# Altium schematic sheet Power-Sheet.SchDoc
size 420 x 297 mm; SheetNumber: 2; SheetTotal: 7
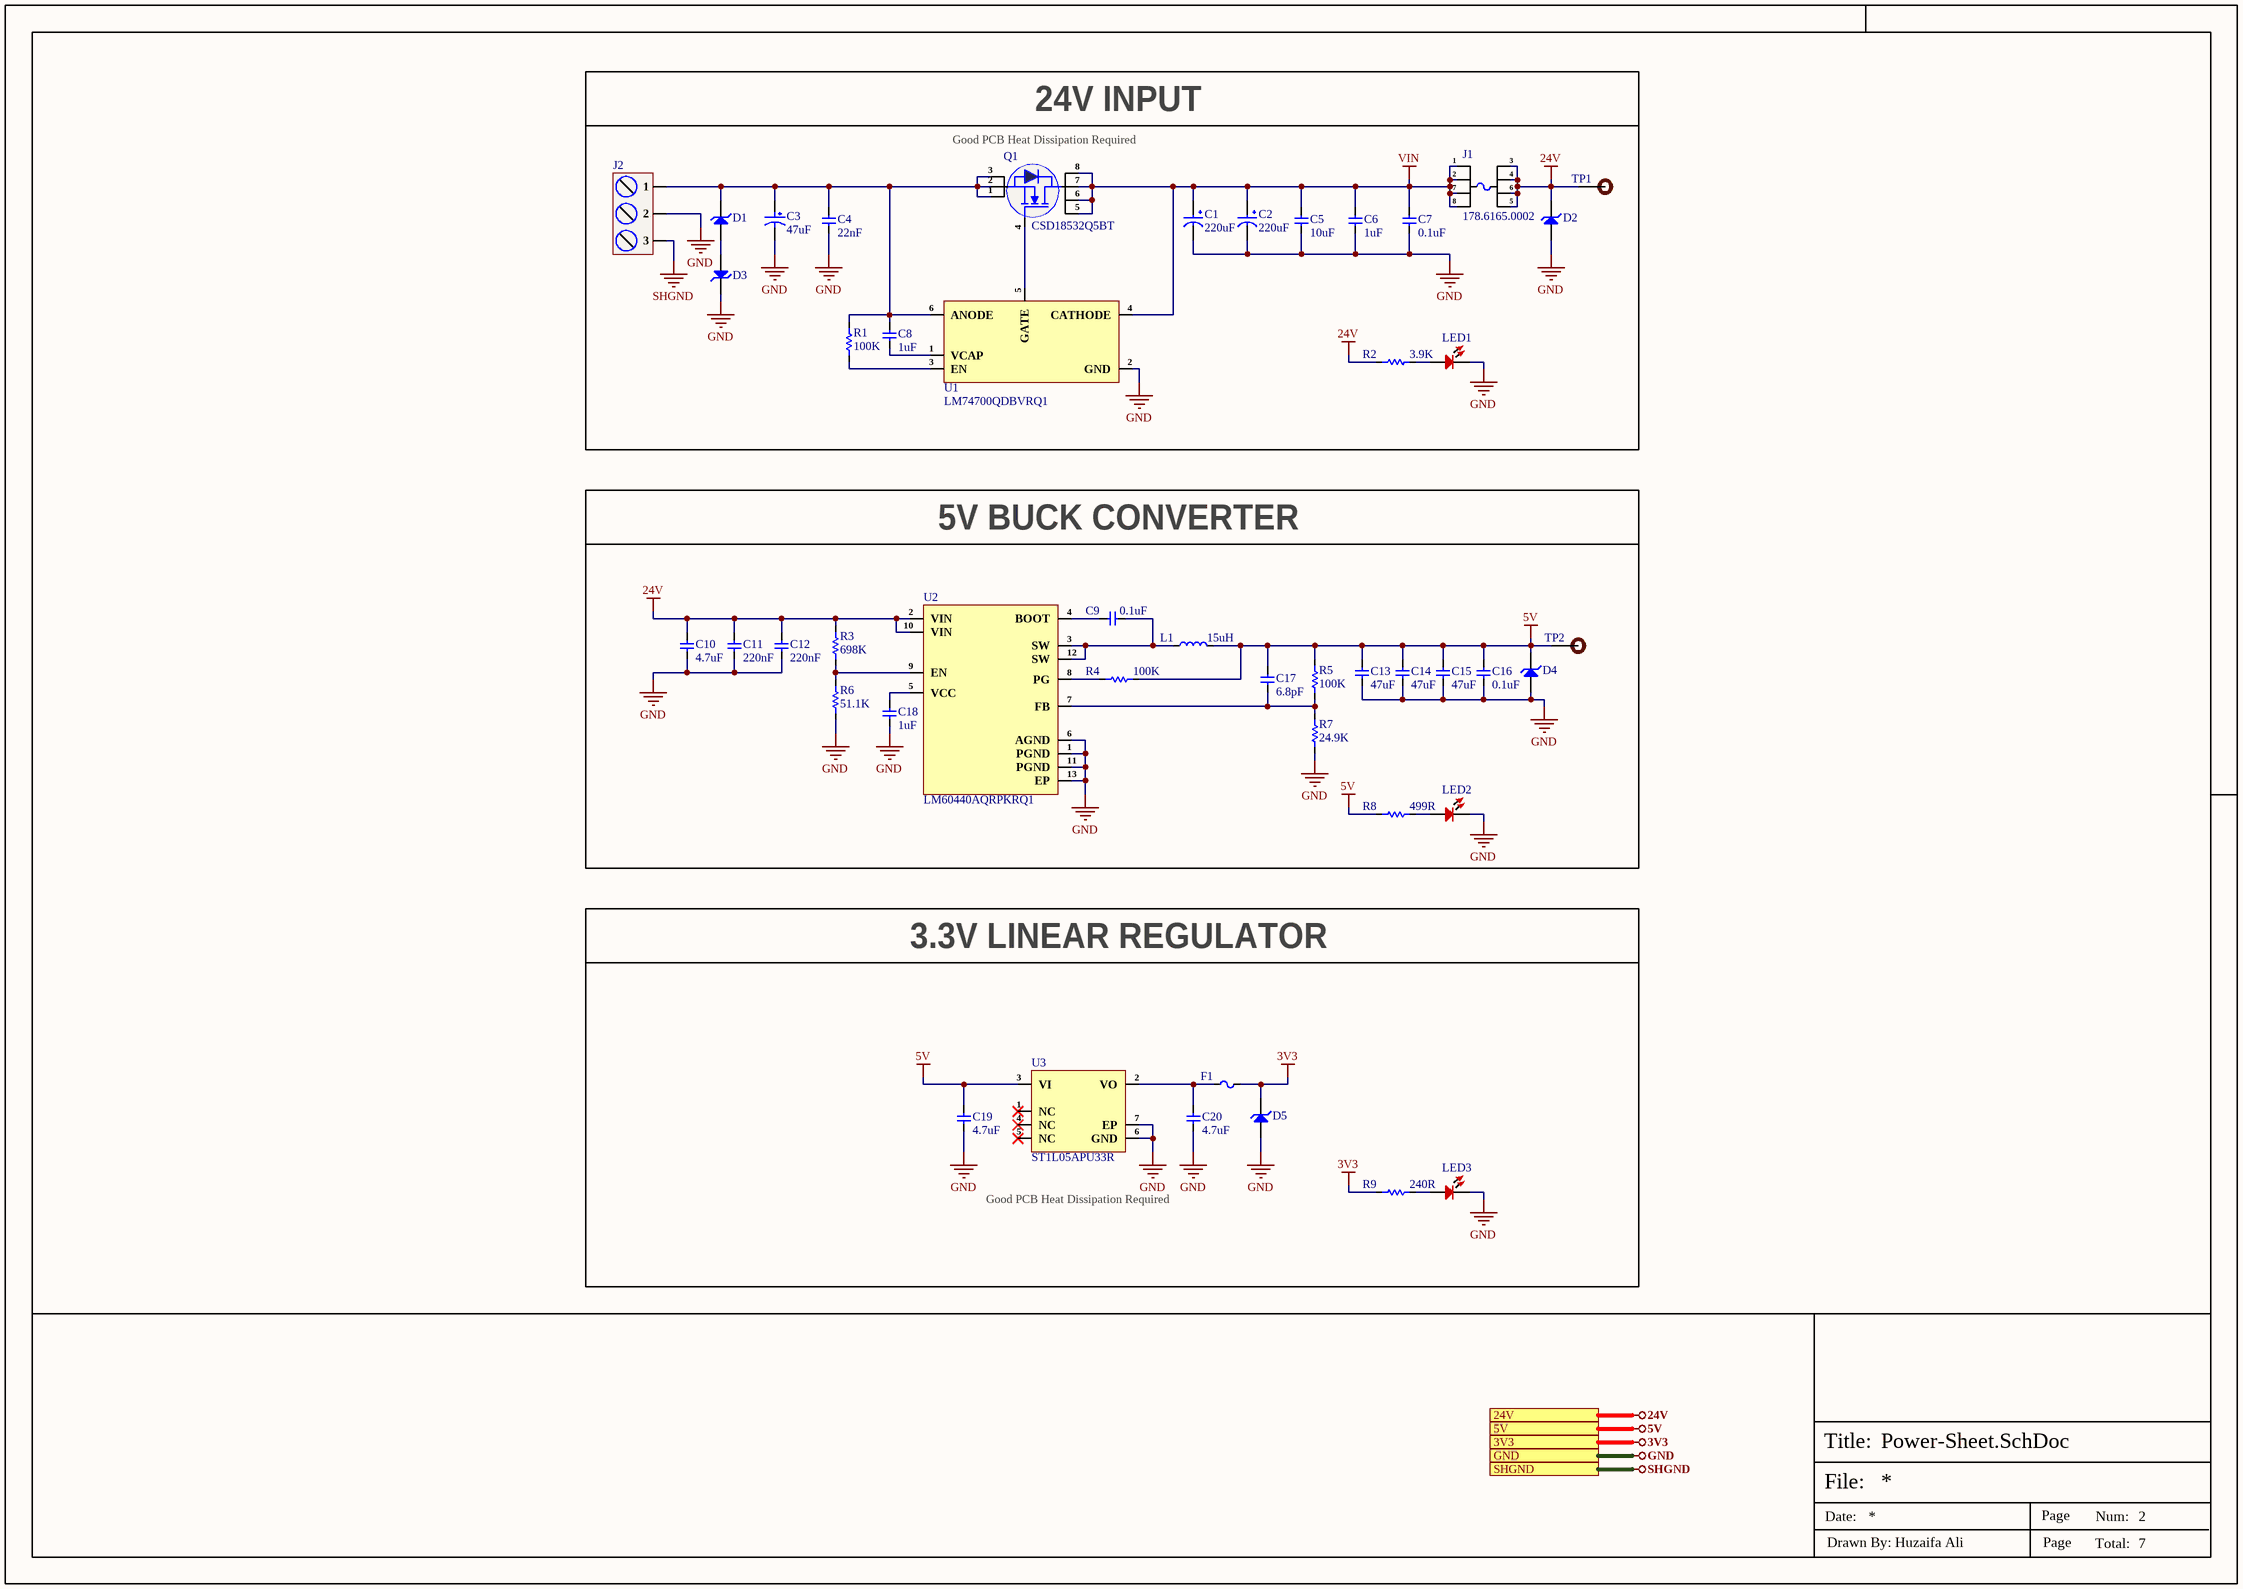
[diagram p0: Power-Sheet.SchDoc]

## Parts
C1  220uF  [UCD-220uF-10mmDia]
C2  220uF  [UCD-220uF-10mmDia]
C3  47uF  [RVT1H470M0607]
C4  22nF  [Cap-0805]
C5  10uF  [Cap-0805]
C6  1uF  [Cap-0603]
C7  0.1uF  [Cap-0603]
C8  1uF  [Cap-0603]
C9  0.1uF  [Cap-0603]
C10  4.7uF  [Cap-1206]
C11  220nF  [Cap-1206]
C12  220nF  [Cap-1206]
C13  47uF  [Cap-1206]
C14  47uF  [Cap-1206]
C15  47uF  [Cap-1206]
C16  0.1uF  [Cap-0603]
C17  6.8pF  [Cap-0402]
C18  1uF  [Cap-0603]
C19  4.7uF  [Cap-1206]
C20  4.7uF  [Cap-1206]
D1  SMBJ58A-13-F  [SMB_]  (value not drawn)
D2  AZ4024-01G  [SOD-123]  (value not drawn)
D3  SMBJ26A-13-F  [SMB_]  (value not drawn)
D4  AZ3005-01G  [SOD-123]  (value not drawn)
D5  AZ3003-01G  [SOD-123]  (value not drawn)
F1  0805L110SLYR  [Fuse-0805]  (value not drawn)
J1  178.6165.0002  [178.6165.0002]
J2  DB128L-5.08-3P-OG-S  [DB128L-5.08-3P-OG-S]  (value not drawn)
L1  15uH  [SRP1265A-150M]
LED1  RED  [LED-0603]  (value not drawn)
LED2  RED  [LED-0603]  (value not drawn)
LED3  RED  [LED-0603]  (value not drawn)
Q1  CSD18532Q5BT  [SON-8(5x6)]
R1  100K  [Res-0402]
R2  3.9K  [Res-0402]
R3  698K  [RES-0805]
R4  100K  [Res-0402]
R5  100K  [Res-0402]
R6  51.1K  [RES-0805]
R7  24.9K  [Res-0402]
R8  499R  [Res-0402]
R9  240R  [Res-0402]
TP1  TEST POINT  [Test-point]  (value not drawn)  (no BOM)
TP2  TEST POINT  [Test-point]  (value not drawn)  (no BOM)
U1  LM74700QDBVRQ1  [SOT-23-6]
U2  LM60440AQRPKRQ1  [13-WQFN-HR (3x2)]
U3  ST1L05APU33R  [DFN-6(3x3)]

## Blocks framed on the sheet
24V INPUT: C1-C8 D1-D3 J1 J2 LED1 Q1 R1 R2 TP1 U1
5V BUCK CONVERTER: C9-C18 D4 L1 LED2 R3-R8 TP2 U2
3.3V LINEAR REGULATOR: C19 C20 D5 F1 LED3 R9 U3

## Ports
3V3 (see Top-Sheet[2A], Comms-Sheet[4D], Controller-Sheet-1[4D], Controller-Sheet-2[4D], Stepper-Driver-Sheet[5D], USB-Sheet[4D]), 5V (see Top-Sheet[2A], Comms-Sheet[4D], Controller-Sheet-2[4D], USB-Sheet[4D]), 24V (see Top-Sheet[2A], Stepper-Driver-Sheet[5D]), GND (see Top-Sheet[2A], Comms-Sheet[4D], Controller-Sheet-1[4D], Controller-Sheet-2[4D], Stepper-Driver-Sheet[5D], USB-Sheet[4D]), SHGND (see Top-Sheet[2A], USB-Sheet[4D])

## Nets
3V3: D5.2(K) F1.2 R9.1 ; port 3V3
5V: C13.2 C14.2 C15.2 C16.2 C17.2 C19.2 D4.2(K) L1.2 R4.1 R5.2 R8.1 TP2.1 U3.3(VI) ; port 5V
24V: C10.2 C11.2 C12.2 D2.2(K) J1.3 J1.4 J1.5 J1.6 R2.1 R3.2 TP1.1 U2.2(VIN) U2.10(VIN) ; port 24V
GND: C1.2 C2.2 C3.2 C4.1 C5.1 C6.1 C7.1 C10.1 C11.1 C12.1 C13.1 C14.1 C15.1 C16.1 C18.1 C19.1 C20.1 D2.1(A) D3.2(K) D4.1(A) D5.1(A) J2.2 LED1.2 LED2.2 LED3.2 R6.1 R7.1 U1.2(GND) U2.1(PGND) U2.6(AGND) U2.11(PGND) U2.13(EP) U3.6(GND) U3.7(EP) ; port GND
SHGND: J2.3 ; port SHGND
VIN: C1.1 C2.1 C5.2 C6.2 C7.2 J1.1 J1.2 J1.7 J1.8 Q1.5(D) Q1.6(D) Q1.7(D) Q1.8(D) U1.4(CATHODE)
NetC3_1: C3.1 C4.2 C8.2 D1.2(K) J2.1 Q1.1(S) Q1.2(S) Q1.3(S) R1.2 U1.6(ANODE)
NetC8_1: C8.1 U1.1(VCAP)
NetC9_1: C9.1 L1.1 U2.3(SW) U2.12(SW)
NetC9_2: C9.2 U2.4(BOOT)
NetC17_1: C17.1 R5.1 R7.2 U2.7(FB)
NetC18_2: C18.2 U2.5(VCC)
NetC20_2: C20.2 F1.1 U3.2(VO)
NetD1_1: D1.1(A) D3.1(A)
NetLED1_1: LED1.1 R2.2
NetLED2_1: LED2.1 R8.2
NetLED3_1: LED3.1 R9.2
NetQ1_4: Q1.4(G) U1.5(GATE)
NetR1_1: R1.1 U1.3(EN)
NetR3_1: R3.1 R6.2 U2.9(EN)
NetR4_2: R4.2 U2.8(PG)

Not connected (* = marked no-connect by the designer): U3 1(NC)* 4(NC)* 5(NC)*

## Notes on the sheet
- (near Q1) Good PCB Heat Dissipation Required
- Good PCB Heat Dissipation Required
- File:
- Title:
- Date:
- Page
- Num:
- Total:
- Drawn By: Huzaifa Ali

## Library data of the parts
C1 C2 = UCD1H221MNL1GS: CAP ALUM 220UF 20% 50V SMD; Manufacturer: Nichicon; Ripple Current: 700mA; Impedance: 160mR; Leakage Current: 3uA; Life (Hours): 5000Hour; Dissipation Factor: 0.1%; Item Type: Capacitor; Supplier 1: Digi-Key; Manufacturer Part Number: UCD1H221MNL1GS; RoHS: Yes; Category: Aluminum Electrolytic Capacitors; Pricing 1: 1=0.85000, 10=0.60200, 50=0.45480, 100=0.39620 (USD); Mount: Surface Mount,PCB; Case/Package: Radial; Min Operating Temperature: -55°C; Max Operating Temperature: 105°C; Capacitance: 220uF; Tolerance: 20%; Voltage Rating: 50V; Packaging: Tape and Reel; Package Quantity: 1; Voltage Rating (DC): 50V; Termination: SMD/SMT; Voltage: 50V; Features: General Purpose; Series: CD; Construction: Cylindrical; Diameter: 10mm; Length: 10mm; Height: 10mm; Height - Seated (Max): 0.394inch; Radiation Hardening: No; Lead Free: Lead Free; RoHS Compliant: Yes; ComponentLink1URL: https://datasheet.ciiva.com/11776/0900766b80ebdadd-11776792.pdf?src-supplier=RSComponents; ComponentLink1Description: https://datasheet.ciiva.com/11776/0900766b80ebdadd-11776792.pdf?src-supplier=RSComponents; ComponentLink2URL: https://datasheet.ciiva.com/5362/e-cd-22158-5362489.pdf?src-supplier=Mouser; ComponentLink2Description: https://datasheet.ciiva.com/5362/e-cd-22158-5362489.pdf?src-supplier=Mouser; ComponentLink3URL: https://datasheet.ciiva.com/11684/e-cd-11684678.pdf?src-supplier=Avnet; ComponentLink3Description: https://datasheet.ciiva.com/11684/e-cd-11684678.pdf?src-supplier=Avnet; ComponentLink4URL: https://datasheet.ciiva.com/15037/e-cd-15037119.pdf?src-supplier=Digi-Key; ComponentLink4Description: https://datasheet.ciiva.com/15037/e-cd-15037119.pdf?src-supplier=Digi-Key; ComponentLink5URL: https://datasheet.ciiva.com/16393/e-cd-16393493.pdf?src-supplier=Future+Electronics; ComponentLink5Description: https://datasheet.ciiva.com/16393/e-cd-16393493.pdf?src-supplier=Future+Electronics; ComponentLink6URL: https://datasheet.ciiva.com/17354/e-cd-17354606.pdf?src-supplier=Avnet+Europe; ComponentLink6Description: https://datasheet.ciiva.com/17354/e-cd-17354606.pdf?src-supplier=Avnet+Europe; Supplier Part Number 1: 493-6390-1-ND; LCSC Part Number: C116211
C3 = RVT1H470M0607: 47uF 50V 66mA@120Hz ±20% SMD,D6.3xL7.7mm Aluminum Electrolytic Capacitors - SMD ROHS; Manufacturer: ROQANG; Manufacturer Part Number: RVT1H470M0607; Package: SMD,D6.3xL7.7mm; LCSC Part Number: C72523; Item Type: Capacitor; ComponentLink1Description: LCSC; ComponentLink1URL: https://www.lcsc.com/product-detail/Aluminum-Electrolytic-Capacitors-SMD_ROQANG-RVT1H470M0607_C72523.html
C4 = CC0805JRX7R0BB223: CAP CER 0.022UF 100V X7R 0805; Manufacturer: Yageo; Item Type: Capacitors; Tolerance: 5%; Supplier: Digikey; LCSC Part Number: C576993; Manufacturer Part Number: CC0805JRX7R0BB223; RoHS: Yes; Stock: 2257; Pricing: 1=0.13, 10=0.07, 50=0.0488, 100=0.0421, 500=0.03086, 1000=0.02736 (USD); Mounting Technology: Surface Mount; Case/Package: 0805; Min Operating Temperature: -55°C; Max Operating Temperature: 125°C; Value: 22nF; Dielectric: X7R; Construction: Flat; Length: 2mm; Height: 0.85mm; Depth: 1.25mm; RoHS Compliant: Yes; ComponentLink1URL: https://datasheet.ciiva.com/11494/upy-np0x7r-mv-100-to-630v-9-11494760.pdf?src-supplier=Avnet; ComponentLink1Description: https://datasheet.ciiva.com/11494/upy-np0x7r-mv-100-to-630v-9-11494760.pdf?src-supplier=Avnet
C5 = GRM21BR61H106ME43L: CAP CER 10UF 50V X5R 0805; Manufacturer: Murata; Supplier 1: Digi-Key; Manufacturer Part Number: GRM21BR61H106ME43L; RoHS: Yes; Category: Ceramic Capacitors; Stock 1: 26; Pricing 1: 1=0.44000, 10=0.30700, 50=0.21500, 100=0.18420, 500=0.13818, 1000=0.11668 (USD); Supplier Part Number 1: 490-18664-1-ND; LCSC Part Number: C2190942
C6 C8 C18 = CL10A105KB8NNNC: CAP CER 1UF 50V X5R 0603; Manufacturer: Samsung; Material: 4241ConductorMaterial; Tolerance: 10%; Item Type: Capacitor; Supplier: Avnet; Supplier Part Number: CL10A105KB8NNNC; Manufacturer Part Number: CL10A105KB8NNNC; RoHS: Yes; Category: Ceramic Capacitors; Stock: 780446; Pricing: 4000=0.01632, 8000=0.01595, 16000=0.01557, 24000=0.0152, 32000=0.01482 (USD); Mounting Technology: Surface Mount; Case/Package: 0603; Case Code (Metric): 1608; Case Code (Imperial): 0603; Min Operating Temperature: -55°C; Max Operating Temperature: 85°C; Packaging: Tape and Reel; Value: 1uF; Voltage Rating: 50V; Dielectric: X5R; Series: CL; Voltage Rating (DC): 50V; Length: 1.6mm; Depth: 0.8mm; Radiation Hardening: No; RoHS Compliant: Yes; ComponentLink1URL: https://datasheet.ciiva.com/26877/getdatasheetpartid-753736-26877879.pdf?src-supplier=Verical; ComponentLink1Description: https://datasheet.ciiva.com/26877/getdatasheetpartid-753736-26877879.pdf?src-supplier=Verical; LCSC Part Number: C15849
C7 C9 C16 = CL10B104KB8WPNC: CAP CER 0.1UF 50V X7R 0603; Item Type: Capacitor; Material: 4241ConductorMaterial; Value: 100nF; Tolerance: 10%; LCSC Part Number: C307348; ComponentLink1Description: LCSC; Supplier: Rs; Supplier Part Number: 2575919; RoHS: Yes; Category: Ceramic Capacitors; Stock: 400; Pricing: 100=0.021, 500=0.019, 1000=0.015, 2000=0.01 (GBP); Mounting Technology: Surface Mount; Case/Package: 0603; Case Code (Metric): 1608; Case Code (Imperial): 0603; Min Operating Temperature: -55°C; Max Operating Temperature: 125°C; Packaging: Cut Tape; Voltage Rating: 50V; Series: CL; Voltage Rating (DC): 50V; Height: 900um; Ratings: AEC-Q200; RoHS Compliant: Yes; Lead Free: 5697LeadFree; ComponentLink2URL: http://www.farnell.com/datasheets/2710560.pdf?src-supplier=Farnell; ComponentLink2Description: http://www.farnell.com/datasheets/2710560.pdf?src-supplier=Farnell; ComponentLink3URL: http://www.samsungsem.com/kr/support/product-search/mlcc/CL10B104KB8WPNC.jsp?src-supplier=Digi-Key; ComponentLink3Description: http://www.samsungsem.com/kr/support/product-search/mlcc/CL10B104KB8WPNC.jsp?src-supplier=Digi-Key; ComponentLink4URL: http://www.farnell.com/datasheets/2710560.pdf?src-supplier=Element14; ComponentLink4Description: http://www.farnell.com/datasheets/2710560.pdf?src-supplier=Element14; ComponentLink5URL: https://datasheet.octopart.com/CL10B104KB8WPNC-Samsung-Electro-Mechanics-datasheet-120093645.pdf?src-supplier=Future+Electronics; ComponentLink5Description: https://datasheet.octopart.com/CL10B104KB8WPNC-Samsung-Electro-Mechanics-datasheet-120093645.pdf?src-supplier=Future+Electronics; ComponentLink6URL: http://www.farnell.com/datasheets/2710560.pdf?src-supplier=Newark; ComponentLink6Description: http://www.farnell.com/datasheets/2710560.pdf?src-supplier=Newark; ComponentLink7URL: http://www.samsungsem.com/servlet/FileDownload?type=spec&file=CL10B104KB8WPNC.pdf&src-supplier=Avnet; ComponentLink7Description: http://www.samsungsem.com/servlet/FileDownload?type=spec&file=CL10B104KB8WPNC.pdf&src-supplier=Avnet; ComponentLink8URL: https://datasheet.octopart.com/CL10B104KB8WPNC-Samsung-datasheet-8326407.pdf?src-supplier=TME; ComponentLink8Description: https://datasheet.octopart.com/CL10B104KB8WPNC-Samsung-datasheet-8326407.pdf?src-supplier=TME
C10 C19 C20 = UMK316AB7475KL-T: CAP CER 4.7UF 50V X7R 1206; Manufacturer: Taiyo Yuden; Item Type: Capacitor; Tolerance: 10%; Supplier: Digikey; LCSC Part Number: C92853; Manufacturer Part Number: UMK316AB7475KL-T; RoHS: Yes; Stock: 392550; Pricing: 1=0.3, 10=0.198, 50=0.146, 100=0.1189, 500=0.09386, 1000=0.07925 (USD); Mounting Technology: Surface Mount; Case/Package: 1206; Pins: 2; Case Code (Metric): 3216; Case Code (Imperial): 1206; Min Operating Temperature: -55°C; Max Operating Temperature: 125°C; Value: 4.7uF; Voltage Rating: 50V; Packaging: Tape and Reel; Package Quantity: 2000; Voltage Rating (DC): 50V; Dielectric: X7R; Termination: SMD/SMT; Series: M; Construction: Flat; Length: 3.2mm; Width: 1.6mm; Height: 1.6mm; Depth: 1.6mm; Radiation Hardening: No; RoHS Compliant: Yes; Reach SVHC Compliant: Unknown; ComponentLink1URL: https://datasheet.ciiva.com/170/umk316ab7475kl-t-ss-170928.pdf?src-supplier=Digikey; ComponentLink1Description: https://datasheet.ciiva.com/170/umk316ab7475kl-t-ss-170928.pdf?src-supplier=Digikey; ComponentLink2URL: https://datasheet.ciiva.com/2990/umk316ab7475kl-t-ss-2990070.pdf?src-supplier=Avnet; ComponentLink2Description: https://datasheet.ciiva.com/2990/umk316ab7475kl-t-ss-2990070.pdf?src-supplier=Avnet; ComponentLink3URL: https://datasheet.ciiva.com/15922/1010umk316ab7475kl-t-15922628.pdf?src-supplier=Onlinecomponents.com; ComponentLink3Description: https://datasheet.ciiva.com/15922/1010umk316ab7475kl-t-15922628.pdf?src-supplier=Onlinecomponents.com; ComponentLink4URL: https://datasheet.ciiva.com/7975/1481447-7975911.pdf?src-supplier=Element14; ComponentLink4Description: https://datasheet.ciiva.com/7975/1481447-7975911.pdf?src-supplier=Element14; ComponentLink5URL: https://datasheet.ciiva.com/5413/mlcc-all-e-541559-5413006.pdf?src-supplier=Mouser; ComponentLink5Description: https://datasheet.ciiva.com/5413/mlcc-all-e-541559-5413006.pdf?src-supplier=Mouser
C11 C12 = CC1206JKX7R9BB224: CAP CER 0.22UF 50V X7R 1206; Manufacturer: Yageo; Item Type: Capacitor; Supplier: Future Electronics; Supplier Part Number: 4639209; Manufacturer Part Number: CC1206JKX7R9BB224; RoHS: Yes; Category: Ceramic Capacitors; Stock: 3000; Pricing: 3000=0.0381, 9000=0.0366, 15000=0.036, 30000=0.0351, 60000=0.0337 (USD); ComponentLink1URL: https://datasheet.ciiva.com/13210/upy-gp-np0-16v-to-50v-8-13210060.pdf?src-supplier=Mouser; ComponentLink1Description: https://datasheet.ciiva.com/13210/upy-gp-np0-16v-to-50v-8-13210060.pdf?src-supplier=Mouser; ComponentLink2URL: https://datasheet.ciiva.com/11466/upy-gphc-x7r-6-3v-to-50v-8-11466351.pdf?src-supplier=Avnet; ComponentLink2Description: https://datasheet.ciiva.com/11466/upy-gphc-x7r-6-3v-to-50v-8-11466351.pdf?src-supplier=Avnet; LCSC Part Number: C527274
C13-C15 = GRM31CR61E476ME44L: CAP CER 47UF 25V X5R 1206; Manufacturer: Murata; Tolerance: 20%; Item Type: Capacitor; Supplier 1: Digi-Key; Manufacturer Part Number: GRM31CR61E476ME44L; RoHS: Yes; Category: Ceramic Capacitors; Capacitance: 47uF; Voltage Rating (DC): 25V; Dielectric: X5R; Length: 3.2mm; Width: 1.6mm; Thickness: 1.6mm; ComponentLink1URL: https://search.murata.co.jp/Ceramy/image/img/A01X/partnumbering_e_01.pdf?src-supplier=Digi-Key; ComponentLink1Description: https://search.murata.co.jp/Ceramy/image/img/A01X/partnumbering_e_01.pdf?src-supplier=Digi-Key; Supplier Part Number 1: 490-16268-2-ND; LCSC Part Number: C403725
C17 = CC0402CRNPO9BN6R8: CAP CER 6.8PF 50V C0G/NPO 0402; Manufacturer: Yageo; Dielectric: C0G; Tolerance: 2%; Insulation Resistance: 10GR; Item Type: Capacitor; Supplier: Future Electronics; Supplier Part Number: 3247368; Manufacturer Part Number: CC0402CRNPO9BN6R8; RoHS: Yes; Category: Ceramic Capacitors; Stock: 200000; Pricing: 10000=0.0024, 40000=0.0022, 150000=0.0021, 400000=0.002, 1000000=0.0019 (USD); Mounting Technology: Surface Mount; Case/Package: 0402; Case Code (Imperial): 0402; Case Code (Metric): 1005; Weight: 2.3E-05oz; Min Operating Temperature: -55°C; Max Operating Temperature: 125°C; Value: 6.8pF; Packaging: Tape and Reel; Voltage Rating: 50V; Voltage Rating (DC): 50V; Termination: SMD/SMT; Series: CC; Construction: Flat; Length: 1mm; Width: 0.5mm; Height: 0.5mm; Depth: 0.5mm; Radiation Hardening: No; RoHS Compliant: Yes; ComponentLink1URL: https://datasheet.ciiva.com/11587/upy-gp-np0-16v-to-50v-8-11587182.pdf?src-supplier=Avnet; ComponentLink1Description: https://datasheet.ciiva.com/11587/upy-gp-np0-16v-to-50v-8-11587182.pdf?src-supplier=Avnet; LCSC Part Number: C189470
D1 = SMBJ58A-13-F: TVS DIODE 58VWM 93.6VC SMB; Manufacturer: Diodes; Supplier: Future Electronics; LCSC Part Number: C135085; Manufacturer Part Number: SMBJ58A-13-F; RoHS: Yes; Item Type: Diode; Stock: 6000; Pricing: 3000=0.0711, 9000=0.0684, 15000=0.0671, 30000=0.0655, 60000=0.063 (USD); ComponentLink1URL: https://datasheet.ciiva.com/25624/0900766b8104bed2-25624843.pdf?src-supplier=Rs; ComponentLink1Description: https://datasheet.ciiva.com/25624/0900766b8104bed2-25624843.pdf?src-supplier=Rs; ComponentLink2URL: https://datasheet.ciiva.com/15143/getdatasheetpartid-39642-15143045.pdf?src-supplier=Verical; ComponentLink2Description: https://datasheet.ciiva.com/15143/getdatasheetpartid-39642-15143045.pdf?src-supplier=Verical; ComponentLink3URL: https://datasheet.ciiva.com/4520/ds19002-4520617.pdf?src-supplier=Mouser; ComponentLink3Description: https://datasheet.ciiva.com/4520/ds19002-4520617.pdf?src-supplier=Mouser; ComponentLink4URL: https://datasheet.ciiva.com/16393/ds19002-16393005.pdf?src-supplier=Future+Electronics; ComponentLink4Description: https://datasheet.ciiva.com/16393/ds19002-16393005.pdf?src-supplier=Future+Electronics
D2 = AZ4024-01G: 26.7V 24V SOD-123 ESD and Surge Protection (TVS/ESD) ROHS; Manufacturer: AMAZING; Manufacturer Part Number: AZ4024-01G; Package: SOD-123; LCSC Part Number: C5571859; Item Type: (TVS/ESD); ComponentLink1Description: LCSC; ComponentLink1URL: https://www.lcsc.com/product-detail/ESD-and-Surge-Protection-TVS-ESD_AMAZING-AZ4024-01G_C5571859.html
D3 = SMBJ26A-13-F: TVS DIODE 26VWM 42.1VC SMB; Manufacturer: Diodes; Item Type: TVS Diodes; Supplier: Future Electronics; Supplier Part Number: 3363900; Manufacturer Part Number: SMBJ26A-13-F; RoHS: Yes; Stock: 9000; Pricing: 3000=0.0717, 9000=0.069, 15000=0.0677, 30000=0.0661, 60000=0.0635 (USD); ComponentLink1URL: https://datasheet.ciiva.com/15143/getdatasheetpartid-118169-15143570.pdf?src-supplier=Verical; ComponentLink1Description: https://datasheet.ciiva.com/15143/getdatasheetpartid-118169-15143570.pdf?src-supplier=Verical; ComponentLink2URL: https://datasheet.ciiva.com/16211/ds19002-16211003.pdf?src-supplier=Future+Electronics; ComponentLink2Description: https://datasheet.ciiva.com/16211/ds19002-16211003.pdf?src-supplier=Future+Electronics; LCSC Part Number: C135062
D4 = AZ3005-01G: 6V 5V SOD-123 ESD and Surge Protection (TVS/ESD) ROHS; Manufacturer: AMAZING; Manufacturer Part Number: AZ3005-01G; Package: SOD-123; LCSC Part Number: C7079241; Item Type: (TVS/ESD); ComponentLink1Description: LCSC; ComponentLink1URL: https://www.lcsc.com/product-detail/ESD-and-Surge-Protection-TVS-ESD_AMAZING-AZ3005-01G_C7079241.html
D5 = AZ3003-01G: TVS SURGE PROTECTOR 1-CH 3.3V; Manufacturer: Amazing; Item Type: Diode; Manufacturer Part Number: AZ3003-01G; Package: SOD-123; LCSC Part Number: -; ComponentLink1Description: Digikey; ComponentLink1URL: https://www.digikey.com/en/products/detail/amazing/AZ3003-01G/16615352?s=N4IgTCBcDaIIIC0DMAGFSC0KCMBxEAugL5A
F1 = 0805L110SLYR: PTC RESET FUSE 6V 1.1A 0805; Manufacturer: Littelfuse; Item Type: Fuses; Supplier: Digikey; LCSC Part Number: C207024; Manufacturer Part Number: 0805L110SLYR; RoHS: Yes; Stock: 3032; Pricing: 1=1.74, 5=1.448, 10=1.339, 50=1.1156, 100=1.0309, 250=0.92832, 500=0.85714, 1000=0.79108 (USD); ComponentLink1URL: https://datasheet.ciiva.com/326/littelfuse-resettable-ptcs-lorho-datasheet-326160.pdf?src-supplier=Digikey; ComponentLink1Description: https://datasheet.ciiva.com/326/littelfuse-resettable-ptcs-lorho-datasheet-326160.pdf?src-supplier=Digikey; ComponentLink2URL: https://datasheet.ciiva.com/28410/949281-28410775.pdf?src-supplier=Element14; ComponentLink2Description: https://datasheet.ciiva.com/28410/949281-28410775.pdf?src-supplier=Element14
J1 = 178.6165.0002: FUSE HOLDER BLADE 80V PCB; Manufacturer: Littelfuse Wickmann; Body Material: 4896ConductorMaterial; Current Rating: 30A; Supplier: Future Electronics; Supplier Part Number: 9883406; Manufacturer Part Number: 178.6165.0002; RoHS: Yes; Category: Fuse Holders; Stock: 3811; Pricing: 1=2.02, 40=1.96, 125=1.91, 400=1.86, 1250=1.77 (USD); Material: 4896ConductorMaterial; Width: 17.5mm; Thickness: 6mm; Lead Free: 5697LeadFree; ComponentLink1URL: https://datasheet.ciiva.com/295/littelfuse-ato-pcb-fuse-holders-178-6765-295568.pdf?src-supplier=Digikey; ComponentLink1Description: https://datasheet.ciiva.com/295/littelfuse-ato-pcb-fuse-holders-178-6765-295568.pdf?src-supplier=Digikey; ComponentLink2URL: https://datasheet.ciiva.com/4480/flrholder-58019-4480354.pdf?src-supplier=Mouser; ComponentLink2Description: https://datasheet.ciiva.com/4480/flrholder-58019-4480354.pdf?src-supplier=Mouser; ComponentLink3URL: https://datasheet.ciiva.com/16372/flrholder-16372408.pdf?src-supplier=Future+Electronics; ComponentLink3Description: https://datasheet.ciiva.com/16372/flrholder-16372408.pdf?src-supplier=Future+Electronics; ComponentLink4URL: https://datasheet.ciiva.com/15187/getdatasheetpartid-31610-15187861.pdf?src-supplier=Verical; ComponentLink4Description: https://datasheet.ciiva.com/15187/getdatasheetpartid-31610-15187861.pdf?src-supplier=Verical; LCSC Part Number: C207061; Item Type: Fuse Holder
J2 = DB128L-5.08-3P-OG-S: 1x3P 18A -40℃~+105℃ 250V Orange 12~30 Direct Insert 5.08mm 2.5 1 3 Plugin,P=5.08mm Screw Terminal Blocks ROHS; Manufacturer: DORABO; Manufacturer Part Number: DB128L-5.08-3P-OG-S; Package: Plugin,P=5.08mm; LCSC Part Number: C430604; Item Type: Terminal Block; ComponentLink1Description: LCSC; ComponentLink1URL: https://www.lcsc.com/product-detail/Screw-Terminal-Blocks_DORABO-DB128L-5-08-3P-OG-S_C430604.html
L1 = SRP1265A-150M: FIXED IND 15UH 9A 28 MOHM SMD; Manufacturer: Bourns; Item Type: Inductors; Supplier: Digikey; LCSC Part Number: C189912; Manufacturer Part Number: SRP1265A-150M; RoHS: Yes; Stock: 3333; Pricing: 1=1.86, 10=1.446, 25=1.3076, 50=1.2114, 100=1.1221, 250=1.0136 (USD); ComponentLink1URL: http://www.mouser.com/ds/2/54/SRP1265A-558458.pdf?src-supplier=Mouser; ComponentLink1Description: http://www.mouser.com/ds/2/54/SRP1265A-558458.pdf?src-supplier=Mouser; ComponentLink2URL: https://media.digikey.com/pdf/Data%20Sheets/Bourns%20PDFs/SRP_Series_Bltn.pdf?src-supplier=Digikey; ComponentLink2Description: https://media.digikey.com/pdf/Data%20Sheets/Bourns%20PDFs/SRP_Series_Bltn.pdf?src-supplier=Digikey; ComponentLink3URL: http://components.arrow.com/part/dataview/66888460S852199N9116?src-supplier=Arrow+Electronics; ComponentLink3Description: http://components.arrow.com/part/dataview/66888460S852199N9116?src-supplier=Arrow+Electronics; ComponentLink4URL: http://www.farnell.com/datasheets/2059704.pdf?src-supplier=Farnell; ComponentLink4Description: http://www.farnell.com/datasheets/2059704.pdf?src-supplier=Farnell; ComponentLink5URL: http://uk.rs-online.com/webdocs/133a/0900766b8133ab5d.pdf?src-supplier=Rs; ComponentLink5Description: http://uk.rs-online.com/webdocs/133a/0900766b8133ab5d.pdf?src-supplier=Rs; ComponentLink6URL: http://www.alliedelec.com/images/products/datasheets/bm/BOURNS/70377570.pdf?src-supplier=Allied+Electronics; ComponentLink6Description: http://www.alliedelec.com/images/products/datasheets/bm/BOURNS/70377570.pdf?src-supplier=Allied+Electronics; ComponentLink7URL: https://datasheet.octopart.com/SRP1265A-150M-Bourns-datasheet-57227458.pdf?src-supplier=Newark; ComponentLink7Description: https://datasheet.octopart.com/SRP1265A-150M-Bourns-datasheet-57227458.pdf?src-supplier=Newark; ComponentLink8URL: http://www.bourns.com/data/global/pdfs/SRP1265A.pdf?src-supplier=Avnet; ComponentLink8Description: http://www.bourns.com/data/global/pdfs/SRP1265A.pdf?src-supplier=Avnet; ComponentLink9URL: http://www.farnell.com/datasheets/2059704.pdf?src-supplier=Newark; ComponentLink9Description: http://www.farnell.com/datasheets/2059704.pdf?src-supplier=Newark; ComponentLink10URL: http://www.farnell.com/datasheets/2059704.pdf?src-supplier=Element14; ComponentLink10Description: http://www.farnell.com/datasheets/2059704.pdf?src-supplier=Element14
LED1-LED3 = NCD0603R3: RED LED 0603 Light Emitting Diodes; Manufacturer: Foshan NationStar Optoelectronics; Manufacturer Part Number: NCD0603R3; Package: 0603; Item Type: LED; LCSC Part Number: C3151730; ComponentLink1Description: LCSC; ComponentLink1URL: https://www.lcsc.com/product-detail/Light-Emitting-Diodes-LED_Foshan-NationStar-Optoelectronics-NCD0603R3_C3151730.html
Q1 = CSD18532Q5BT: MOSFET N-CH 60V 100A 8VSON; Manufacturer: Texas Instruments; Item Type: MOSFETs; Supplier: Mouser; LCSC Part Number: C2876541; Manufacturer Part Number: CSD18532Q5BT; RoHS: Yes; Stock: 1375; Pricing: 1=2.24, 10=2.01, 50=2.01, 100=1.79, 1000=1.34, 10000=1.23 (USD); ComponentLink1URL: http://www.ti.com/general/docs/lit/getliterature.tsp?genericPartNumber=CSD18532Q5B&&fileType=pdf&src-supplier=Avnet; ComponentLink1Description: http://www.ti.com/general/docs/lit/getliterature.tsp?genericPartNumber=CSD18532Q5B&&fileType=pdf&src-supplier=Avnet; ComponentLink2URL: http://www.ti.com/general/docs/suppproductinfo.tsp?distId=10&amp;gotoUrl=http%3A%2F%2Fwww.ti.com%2Flit%2Fgpn%2Fcsd18532q5b&src-supplier=Digikey; ComponentLink2Description: http://www.ti.com/general/docs/suppproductinfo.tsp?distId=10&amp;gotoUrl=http%3A%2F%2Fwww.ti.com%2Flit%2Fgpn%2Fcsd18532q5b&src-supplier=Digikey; ComponentLink3URL: http://www.ti.com/lit/ds/symlink/csd18532q5b.pdf?src-supplier=Digikey; ComponentLink3Description: http://www.ti.com/lit/ds/symlink/csd18532q5b.pdf?src-supplier=Digikey; ComponentLink4URL: http://www.ti.com/lit/gpn/csd18532q5b?src-supplier=Mouser; ComponentLink4Description: http://www.ti.com/lit/gpn/csd18532q5b?src-supplier=Mouser
R1 R4 R5 = RT0402BRD07100KL: RES SMD 100K OHM 0.1% 1/16W 0402; Manufacturer: Yageo; Voltage Rating (DC): 50V; Item Type: Resistor; Manufacturer Part Number: RT0402BRD07100KL; RoHS: Yes; Category: Chip SMD Resistors; ComponentLink1URL: https://datasheet.ciiva.com/12724/pyu-rt-1-to-0-05-rohs-l-4-12724954.pdf?src-supplier=Mouser; ComponentLink1Description: https://datasheet.ciiva.com/12724/pyu-rt-1-to-0-05-rohs-l-4-12724954.pdf?src-supplier=Mouser; LCSC Part Number: C852472; Supplier: Digikey; Supplier Part Number: YAG1343CT-ND; Stock: 62932; Pricing: 1=0.16, 10=0.121, 50=0.0958, 100=0.0859, 500=0.0654, 1000=0.0578, 5000=0.04283 (USD)
R2 = RC0402FR-073K9L: RES 3.9K OHM 1% 1/16W 0402; Manufacturer: Yageo; Temperature Coefficient: 100ppm/°C; Power Rating: 62.5mW; Value: 3.9kR; Voltage Rating: 50V; Max Power Dissipation: 63mW; Item Type: Resistor; Supplier: Future Electronics; Supplier Part Number: 9808155; Manufacturer Part Number: RC0402FR-073K9L; RoHS: Yes; Category: Chip SMD Resistors; Stock: 6910000; Pricing: 10000=0.0011, 100000=0.0011, 300000=0.001, 750000=0.001, 2000000=0.0009 (USD); Case/Package: 0402; Case Code (Imperial): 0402; Case Code (Metric): 1005; Min Operating Temperature: -55°C; Max Operating Temperature: 155°C; Tolerance: 1%; Packaging: Tape and Reel; Resistor Type: Thick Film; Series: RC; Termination: SMD/SMT; Number of Terminations: 2; Features: Moisture Resistant; Resistance Tolerance: 1%; Construction: Rectangular; Voltage Rating (AC): 50V; Length: 1mm; Depth: 0.5mm; Lead Free: Lead Free; RoHS Compliant: Yes; Reach SVHC Compliant: Unknown; Military Standard: Not; ComponentLink1URL: https://datasheet.ciiva.com/12666/pyu-rc0402-51-rohs-l-6-r-12666997.pdf?src-supplier=Mouser; ComponentLink1Description: https://datasheet.ciiva.com/12666/pyu-rc0402-51-rohs-l-6-r-12666997.pdf?src-supplier=Mouser; ComponentLink2URL: https://datasheet.ciiva.com/7849/1018594-7849989.pdf?src-supplier=Element14; ComponentLink2Description: https://datasheet.ciiva.com/7849/1018594-7849989.pdf?src-supplier=Element14; ComponentLink3URL: https://datasheet.ciiva.com/7849/1018594-7849990.pdf?src-supplier=Element14; ComponentLink3Description: https://datasheet.ciiva.com/7849/1018594-7849990.pdf?src-supplier=Element14; ComponentLink4URL: https://datasheet.ciiva.com/15189/getdatasheetpartid-469246-15189453.pdf?src-supplier=Verical; ComponentLink4Description: https://datasheet.ciiva.com/15189/getdatasheetpartid-469246-15189453.pdf?src-supplier=Verical; LCSC Part Number: C131467
R3 = RT0805BRD07698KL: RES SMD 698K OHM 0.1% 1/8W 0805; Manufacturer: Yageo; Item Type: Resistor; Value: 698kR; Power Rating: 125mW; Voltage Rating: 150V; Temperature Coefficient: 25ppm/°C; Supplier: Digikey; LCSC Part Number: C865618; Manufacturer Part Number: RT0805BRD07698KL; RoHS: Yes; Stock: 881; Pricing: 1=0.16, 10=0.122, 50=0.0968, 100=0.0867, 500=0.0663, 1000=0.05814 (USD); Case/Package: 0805; Case Code (Metric): 2012; Case Code (Imperial): 0805; Min Operating Temperature: -55°C; Max Operating Temperature: 155°C; Package Quantity: 5000; Packaging: Tape and Reel; Tolerance: 0.1%; Number of Terminations: 2; Termination: SMD/SMT; Max Power Dissipation: 125mW; Voltage Rating (DC): 150V; Features: Moisture Resistant; Series: RT; Length: 0.079inch; Width: 0.049inch; Height: 0.024inch; Lead Free: Lead Free; RoHS Compliant: Yes; ComponentLink1URL: https://datasheet.ciiva.com/2585/pyu-rt-1-to-0-05-rohs-l-4-2585147.pdf?src-supplier=Digikey; ComponentLink1Description: https://datasheet.ciiva.com/2585/pyu-rt-1-to-0-05-rohs-l-4-2585147.pdf?src-supplier=Digikey; ComponentLink2URL: https://datasheet.ciiva.com/46635/pyu-rt-1-to-0-05-rohs-l-5-46635259.pdf?src-supplier=Digikey; ComponentLink2Description: https://datasheet.ciiva.com/46635/pyu-rt-1-to-0-05-rohs-l-5-46635259.pdf?src-supplier=Digikey; ComponentLink3URL: https://datasheet.ciiva.com/12705/pyu-rt-1-to-0-05-rohs-l-4-12705823.pdf?src-supplier=Mouser; ComponentLink3Description: https://datasheet.ciiva.com/12705/pyu-rt-1-to-0-05-rohs-l-4-12705823.pdf?src-supplier=Mouser
R6 = RT0805BRD0751K1L: RES SMD 51.1K OHM 0.1% 1/8W 0805; Manufacturer: Yageo; Item Type: Resistors; Value: 51.1kR; Power Rating: 125mW; Voltage Rating: 150V; Temperature Coefficient: 25ppm/°C; Supplier: Digikey; LCSC Part Number: C865541; Manufacturer Part Number: RT0805BRD0751K1L; RoHS: Yes; Stock: 5132; Pricing: 1=0.16, 10=0.122, 50=0.0968, 100=0.0867, 500=0.0663, 1000=0.05814 (USD); Case/Package: 0805; Case Code (Metric): 2012; Case Code (Imperial): 0805; Weight: 0.000194oz; Min Operating Temperature: -55°C; Max Operating Temperature: 155°C; Package Quantity: 5000; Packaging: Tape and Reel; Tolerance: 0.1%; Number of Terminations: 2; Termination: SMD/SMT; Max Power Dissipation: 125mW; Voltage Rating (DC): 150V; Series: RT; Length: 0.079inch; Width: 1.2mm; Height: 0.024inch; Lead Free: Lead Free; RoHS Compliant: Yes; ComponentLink1URL: https://datasheet.ciiva.com/12811/pyu-rt-1-to-0-05-rohs-l-4-12811148.pdf?src-supplier=Mouser; ComponentLink1Description: https://datasheet.ciiva.com/12811/pyu-rt-1-to-0-05-rohs-l-4-12811148.pdf?src-supplier=Mouser; ComponentLink2URL: https://datasheet.ciiva.com/2585/pyu-rt-1-to-0-05-rohs-l-5-2585074.pdf?src-supplier=Digikey; ComponentLink2Description: https://datasheet.ciiva.com/2585/pyu-rt-1-to-0-05-rohs-l-5-2585074.pdf?src-supplier=Digikey
R7 = RT0402BRD0724K9L: RES SMD 24.9KOHM 0.1% 1/16W 0402; Manufacturer: Yageo; Item Type: Resistors; Supplier: Future Electronics; LCSC Part Number: C852664; Manufacturer Part Number: RT0402BRD0724K9L; RoHS: Yes; Stock: 40000; Pricing: 10000=0.0362, 20000=0.0356, 30000=0.0353, 50000=0.0349, 100000=0.0341 (USD); ComponentLink1URL: https://datasheet.ciiva.com/2582/pyu-rt-1-to-0-05-rohs-l-4-2582251.pdf?src-supplier=Digikey; ComponentLink1Description: https://datasheet.ciiva.com/2582/pyu-rt-1-to-0-05-rohs-l-4-2582251.pdf?src-supplier=Digikey; ComponentLink2URL: https://datasheet.ciiva.com/12721/pyu-rt-1-to-0-05-rohs-l-4-12721846.pdf?src-supplier=Mouser; ComponentLink2Description: https://datasheet.ciiva.com/12721/pyu-rt-1-to-0-05-rohs-l-4-12721846.pdf?src-supplier=Mouser; ComponentLink3URL: https://datasheet.ciiva.com/46635/pyu-rt-1-to-0-05-rohs-l-5-46635119.pdf?src-supplier=Digikey; ComponentLink3Description: https://datasheet.ciiva.com/46635/pyu-rt-1-to-0-05-rohs-l-5-46635119.pdf?src-supplier=Digikey
R8 = RC0402FR-07499RL: RES 499 OHM 1% 1/16W 0402; Manufacturer: Yageo; Power Rating: 62.5mW; Voltage Rating: 50V; Max Power Dissipation: 63mW; Temperature Coefficient: 100ppm/°C; Supplier 1: Mouser; Manufacturer Part Number: RC0402FR-07499RL; RoHS: Yes; Category: Chip SMD Resistors; Stock 1: 936879; Pricing 1: 1=0.10000, 10=0.01200, 50=0.01200, 100=0.00500, 1000=0.00300, 10000=0.00100 (USD); Case/Package: 0402; Case Code (Metric): 1005; Case Code (Imperial): 0402; Size Code: 0402; Min Operating Temperature: -55°C; Max Operating Temperature: 155°C; Resistance: 499R; Tolerance: 1%; Package Quantity: 1; Packaging: Tape and Reel; Resistor Type: Thick Film; Number of Terminations: 2; Termination: SMD/SMT; Voltage Rating (DC): 50V; Features: Moisture Resistant; Series: RC; Resistance Tolerance: 1%; Construction: Rectangular; Length: 1mm; Width: 0.02inch; Height: 0.016inch; Depth: 0.5mm; RoHS Compliant: Yes; REACH SVHC: No SVHC; Military Standard: Not; Lead Free: Lead Free; ComponentLink1URL: https://datasheet.ciiva.com/2453/pyu-r-int-thick-7-2453539.pdf?src-supplier=Digi-Key; ComponentLink1Description: https://datasheet.ciiva.com/2453/pyu-r-int-thick-7-2453539.pdf?src-supplier=Digi-Key; ComponentLink2URL: https://datasheet.ciiva.com/2453/pyu-r-int-thick-7-2453540.pdf?src-supplier=Digi-Key; ComponentLink2Description: https://datasheet.ciiva.com/2453/pyu-r-int-thick-7-2453540.pdf?src-supplier=Digi-Key; ComponentLink3URL: https://datasheet.ciiva.com/2453/pyu-r-int-thick-7-2453538.pdf?src-supplier=Digi-Key; ComponentLink3Description: https://datasheet.ciiva.com/2453/pyu-r-int-thick-7-2453538.pdf?src-supplier=Digi-Key; Supplier Part Number 1: 603-RC0402FR-07499RL; LCSC Part Number: C137970
R9 = RC0402FR-07240RL: RES 240 OHM 1% 1/16W 0402; Manufacturer: Yageo; Item Type: Resistors; Power Rating: 63mW; Temperature Coefficient: 100ppm/°C; Voltage Rating (DC): 50V; Supplier 1: Mouser; Manufacturer Part Number: RC0402FR-07240RL; RoHS: Yes; Stock 1: 1903202; Pricing 1: 1=0.10000, 10=0.01200, 50=0.01200, 100=0.00500, 1000=0.00300, 10000=0.00100 (USD); Case/Package: 0402; Case Code (Metric): 1005; Case Code (Imperial): 0402; Size Code: 0402; Min Operating Temperature: -55°C; Max Operating Temperature: 155°C; Resistance: 240R; Tolerance: 1%; Packaging: Tape and Reel; Resistor Type: Thick Film; Voltage Rating: 50V; Package Quantity: 1; Number of Terminations: 2; Termination: SMD/SMT; Max Power Dissipation: 63mW; Features: Moisture Resistant; Series: RC; Construction: Rectangular; Resistance Tolerance: 1%; Length: 1mm; Width: 0.02inch; Height: 0.016inch; Depth: 0.5mm; REACH SVHC: Unknown; Lead Free: Lead Free; RoHS Compliant: Yes; Military Standard: Not; ComponentLink1URL: https://datasheet.ciiva.com/7849/1018594-7849915.pdf?src-supplier=Element14; ComponentLink1Description: https://datasheet.ciiva.com/7849/1018594-7849915.pdf?src-supplier=Element14; ComponentLink2URL: https://datasheet.ciiva.com/7849/1018594-7849916.pdf?src-supplier=Element14; ComponentLink2Description: https://datasheet.ciiva.com/7849/1018594-7849916.pdf?src-supplier=Element14; ComponentLink3URL: https://datasheet.ciiva.com/2519/pyu-r-int-thick-7-2519157.pdf?src-supplier=Digi-Key; ComponentLink3Description: https://datasheet.ciiva.com/2519/pyu-r-int-thick-7-2519157.pdf?src-supplier=Digi-Key; ComponentLink4URL: https://datasheet.ciiva.com/2519/pyu-r-int-thick-7-2519158.pdf?src-supplier=Digi-Key; ComponentLink4Description: https://datasheet.ciiva.com/2519/pyu-r-int-thick-7-2519158.pdf?src-supplier=Digi-Key; ComponentLink5URL: https://datasheet.ciiva.com/2519/pyu-r-int-thick-7-2519156.pdf?src-supplier=Digi-Key; ComponentLink5Description: https://datasheet.ciiva.com/2519/pyu-r-int-thick-7-2519156.pdf?src-supplier=Digi-Key; ComponentLink6URL: https://datasheet.ciiva.com/12669/pyu-rc0402-51-rohs-l-6-r-12669689.pdf?src-supplier=Mouser; ComponentLink6Description: https://datasheet.ciiva.com/12669/pyu-rc0402-51-rohs-l-6-r-12669689.pdf?src-supplier=Mouser; ComponentLink7URL: https://datasheet.ciiva.com/17419/pyu-rc0402-51-rohs-l-6-r-17419482.pdf?src-supplier=Future+Electronics; ComponentLink7Description: https://datasheet.ciiva.com/17419/pyu-rc0402-51-rohs-l-6-r-17419482.pdf?src-supplier=Future+Electronics; Supplier Part Number 1: 603-RC0402FR-07240RL; LCSC Part Number: C114755
TP1 TP2 = TEST POINT: Test Point ON; Item Type: TEST POINT
U1 = LM74700QDBVRQ1: OR Controller N+1 ORing Controller N-Channel 1:1 SOT-23-6; Manufacturer: Texas Instruments; Max Output current: 5A; Turn-On Delay Time: 1.4us; Turn-Off Delay Time: 450ns; Max Supply Voltage: 65V; Min Supply Voltage: 3.2V; Nominal Supply Current: 80uA; Number of Outputs: 1NUMBER; Item Type: IC; Supplier: Mouser; Supplier Part Number: 595-LM74700QDBVRQ1; Manufacturer Part Number: LM74700QDBVRQ1; RoHS: Yes; Category: Power Management ICs; Stock: 11505; Pricing: 1=1.78, 10=1.6, 50=1.6, 100=1.28, 1000=0.877, 10000=0.756 (USD); Mounting Technology: Surface Mount; Case/Package: SOT-23-6; Pins: 6NUMBER; Min Operating Temperature: -40°C; Max Operating Temperature: 125°C; Series: Automotive, AEC-Q100; Length: 2.9mm; Width: 1.6mm; Height: 1.45mm; Thickness: 1.2mm; RoHS Compliant: Yes; ComponentLink1URL: http://www.ti.com/general/docs/suppproductinfo.tsp?distId=10&amp;gotoUrl=http%3A%2F%2Fwww.ti.com%2Flit%2Fgpn%2Flm74700-q1&src-supplier=Digikey; ComponentLink1Description: http://www.ti.com/general/docs/suppproductinfo.tsp?distId=10&amp;gotoUrl=http%3A%2F%2Fwww.ti.com%2Flit%2Fgpn%2Flm74700-q1&src-supplier=Digikey; LCSC Part Number: C2941042
U2 = LM60440AQRPKRQ1: IC REG BUCK ADJ 4A 13WQFN; Manufacturer: Texas Instruments; Supplier: Mouser; LCSC Part Number: C3187981; Manufacturer Part Number: LM60440AQRPKRQ1; RoHS: Yes; Item Type: IC; Stock: 916; Pricing: 1=2.79, 10=1.91, 50=1.91, 100=1.71, 1000=1.52, 10000=1.45 (USD)
U3 = ST1L05APU33R: IC REG LINEAR 3.3V 1.3A 6DFN; Manufacturer: STMicroelectronics; Supplier: Digikey; LCSC Part Number: C283488; Manufacturer Part Number: ST1L05APU33R; RoHS: Yes; Item Type: IC; Stock: 7599; Pricing: 1=1.06, 10=0.766, 25=0.692, 100=0.6103, 250=0.57136, 500=0.5479, 1000=0.5286 (USD); ComponentLink1URL: https://datasheet.ciiva.com/2053/cd00186925-2053848.pdf?src-supplier=Digikey; ComponentLink1Description: https://datasheet.ciiva.com/2053/cd00186925-2053848.pdf?src-supplier=Digikey; ComponentLink2URL: https://datasheet.ciiva.com/2053/cd00186925-2053849.pdf?src-supplier=Digikey; ComponentLink2Description: https://datasheet.ciiva.com/2053/cd00186925-2053849.pdf?src-supplier=Digikey; ComponentLink3URL: https://datasheet.ciiva.com/2053/cd00186925-2053850.pdf?src-supplier=Digikey; ComponentLink3Description: https://datasheet.ciiva.com/2053/cd00186925-2053850.pdf?src-supplier=Digikey; ComponentLink4URL: https://datasheet.ciiva.com/16489/cd00186925-16489850.pdf?src-supplier=Future+Electronics; ComponentLink4Description: https://datasheet.ciiva.com/16489/cd00186925-16489850.pdf?src-supplier=Future+Electronics